# EAGLE board RK628H-2x22P-RevA (EAGLE 9.7.0)
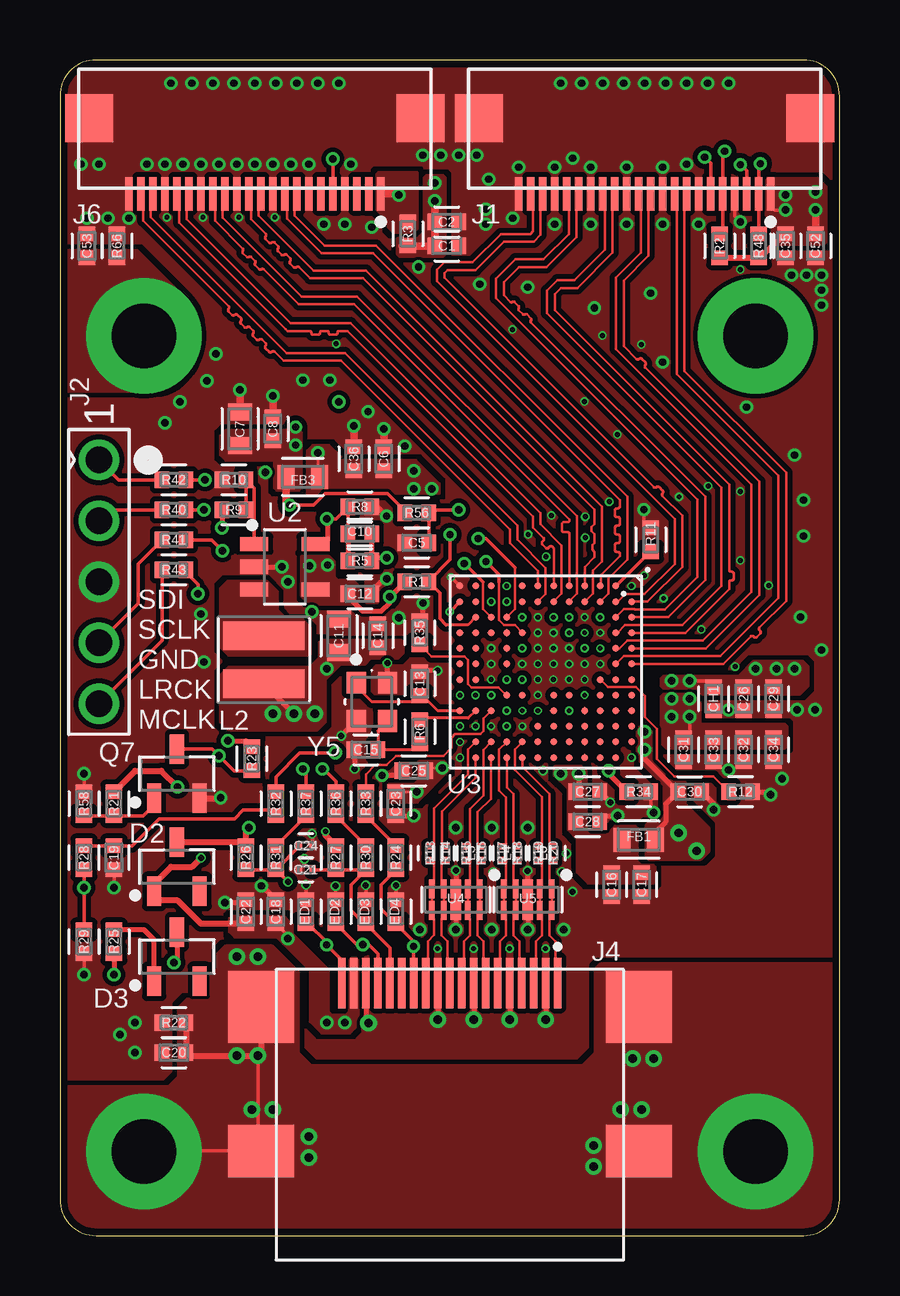
[diagram p6: board, top side]
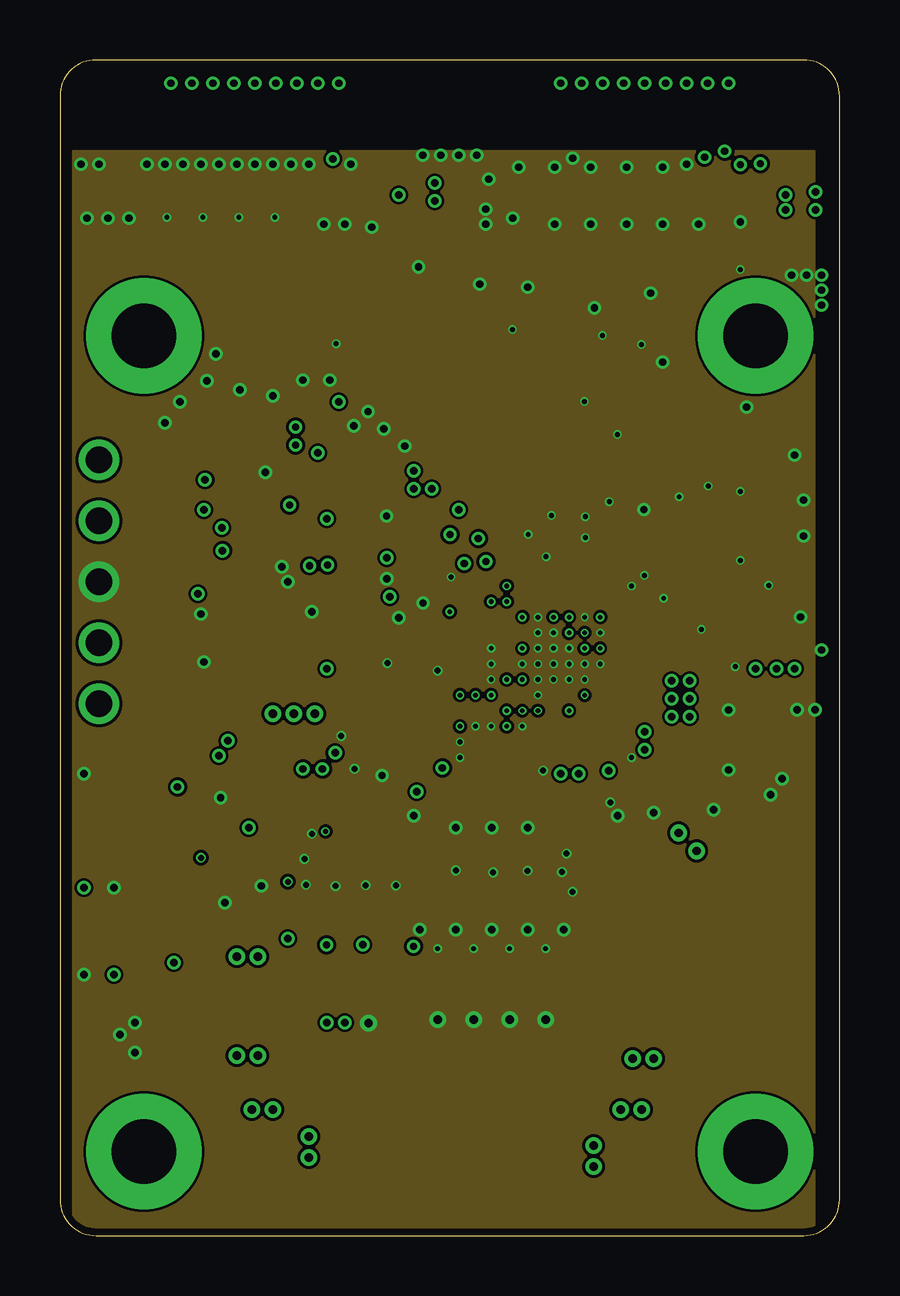
[diagram p7: board, inner layer Route2]
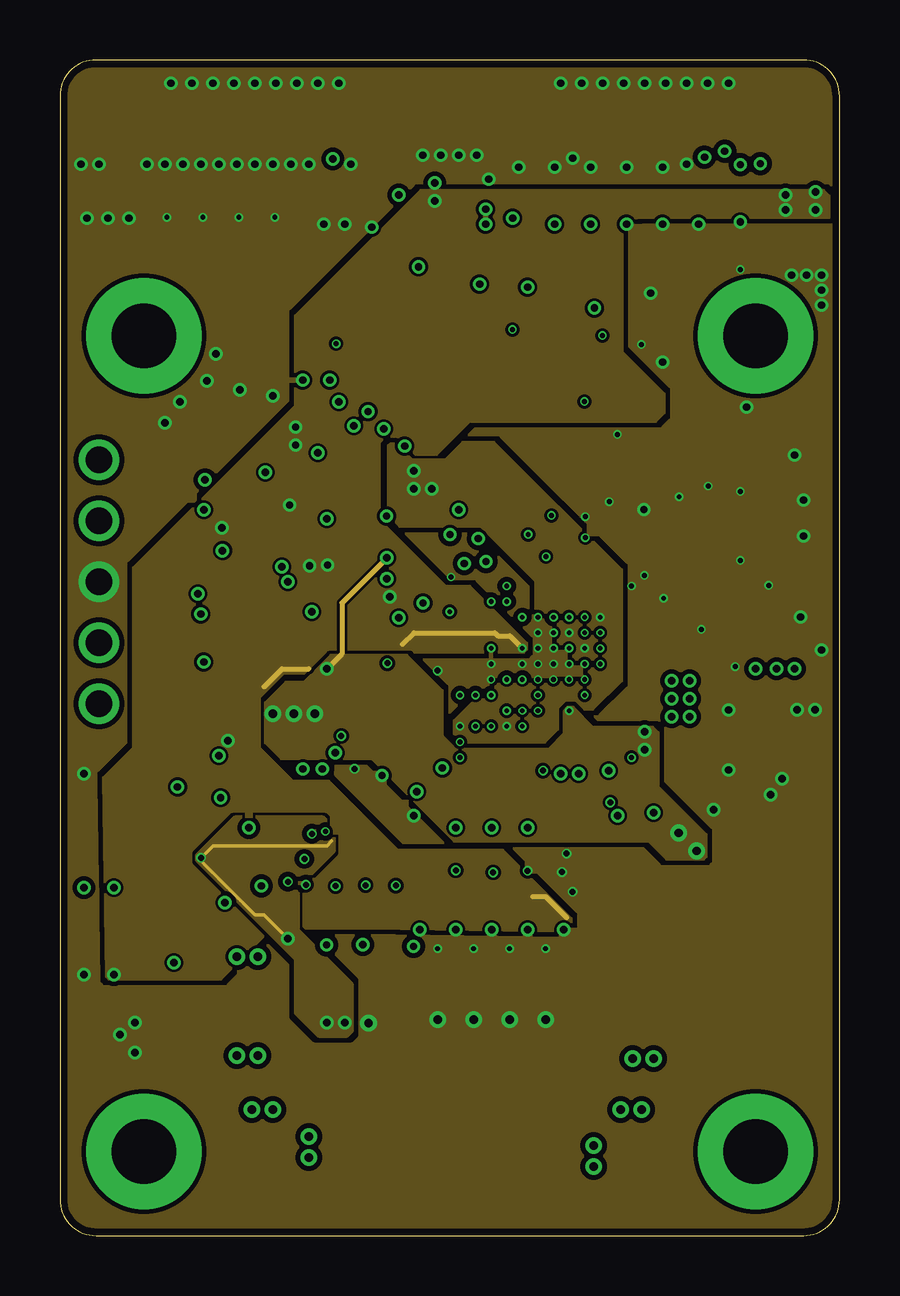
[diagram p8: board, inner layer Route15]
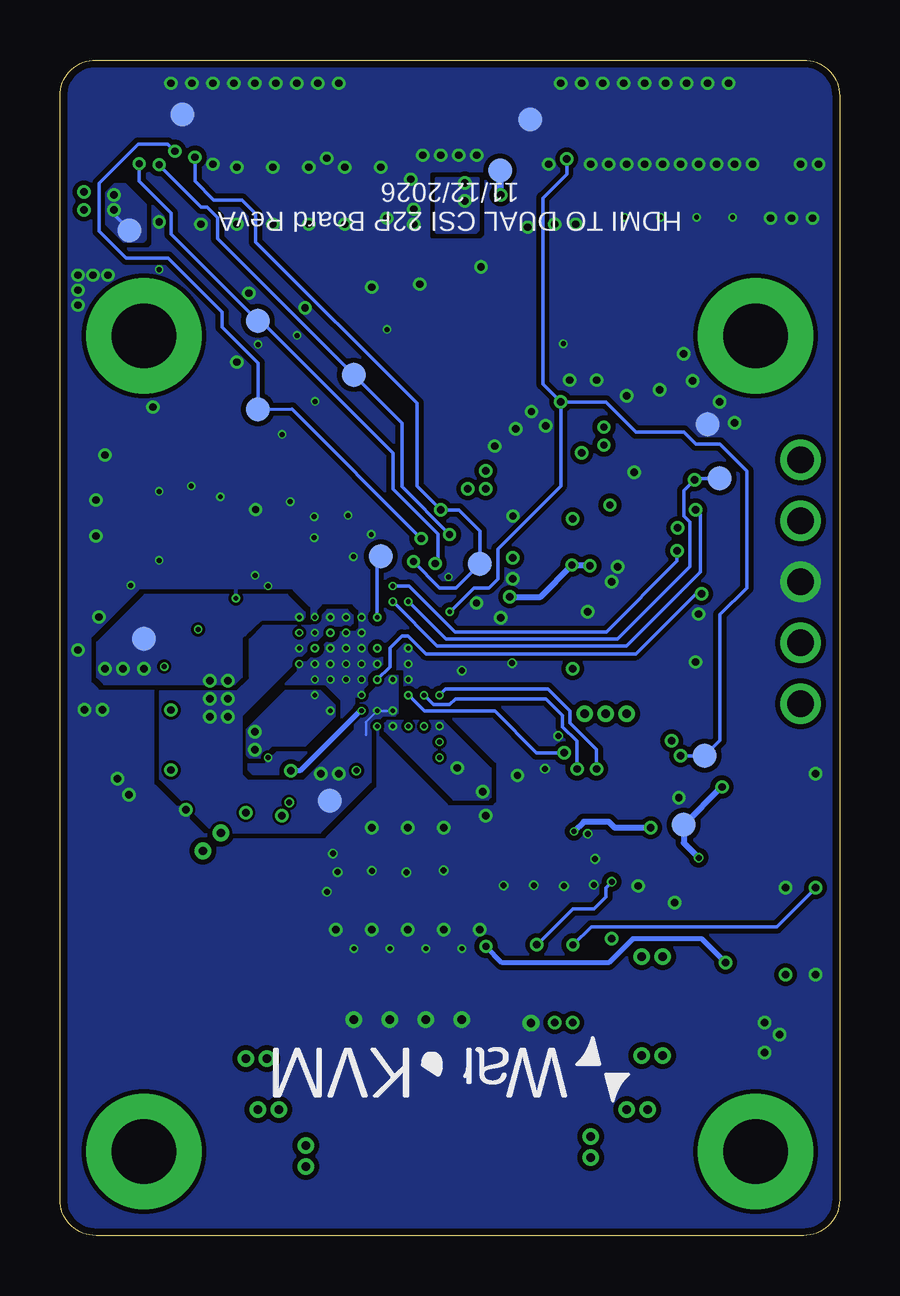
[diagram p9: board, bottom side, seen from below]

Size 32.5 x 49 mm. Coordinates in mm from the lower left corner, seen from the top.
Outline: 0,47.5 0,1.5 arc90 1.5,0 31,0 arc90 32.5,1.5 32.5,47.5 arc90 31,49 1.5,49 arc90 0,47.5
Copper layers (1+2*15+16): Top 0.035mm / dielectric 1.5mm / Route2 0.035mm / dielectric 0.15mm / Route15 0.035mm / dielectric 0.2mm / Bottom 0.035mm
Design rules "Fusion Electronics Design Rules *": minimum track width 0.1mm, minimum drill 0.2mm, track to track 0.12mm, track to pad 0.1mm, pad to pad 0.12mm, via to via 0.12mm, smd to smd 0.14mm, copper to edge 0.3mm, drill to drill 6mil, minimum pad ring 0mil, minimum via ring 0mil, stop-mask expansion 0mil, vias tented up to drill 9999mil, thermal gap 10mil
Net classes: 4 hdmi_diff: width 0.113 mm

## Footprints (pad centres in the part's own frame; a part is rotated, then mirrored left to right if it is on the bottom)
CAP_0402 = smd 0.6 x 0.7: 1 -0.5,0; 2 0.5,0
CAP_0603 = smd 0.7 x 1: 1 -0.7,0; 2 0.7,0
CAP_0201 = smd 0.25 x 0.35: 1 -0.275,0; 2 0.275,0
SOT-23-3 = smd 1.229 x 0.592: 1 1.022,-0.95; 2 1.022,0.95; 3 -1.022,0
TVS_0402 = smd 0.6 x 0.7: 1 -0.5,0; 2 0.5,0
IND_0603 = smd 0.7 x 1: 1 -0.7,0; 2 0.7,0
CONN_FFC_1X22_0.5MM_SM_RA_0.5K-GX-22PWB-R = smd 0.3 x 1.4: 1 -5.25,1.575; 2 -4.75,1.575; 3 -4.25,1.575; 4 -3.75,1.575; 5 -3.25,1.575; 6 -2.75,1.575; 7 -2.25,1.575; 8 -1.75,1.575; 9 -1.25,1.575; 10 -0.75,1.575; 11 -0.25,1.575; 12 0.25,1.575; 13 0.75,1.575; 14 1.25,1.575; 15 1.75,1.575; 16 2.25,1.575; 17 2.75,1.575; 18 3.25,1.575; 19 3.75,1.575; 20 4.25,1.575; 21 4.75,1.575; 22 5.25,1.575 | smd 2 x 2: 23 -6.9,-1.575; 24 6.9,-1.575
HDR_1X05_2.54MM_TH_ST = drill 1.1 pad 1.7: 1 -5.08,0; 2 -2.54,0; 3 0,0; 4 2.54,0; 5 5.08,0
CONN_HDMI_A_SMT_RA_HC-HDMI0019T-4 = smd 0.3 x 2.1: 1 4.5,6.4; 2 4,6.4; 3 3.5,6.4; 4 3,6.4; 5 2.5,6.4; 6 2,6.4; 7 1.5,6.4; 8 1,6.4; 9 0.5,6.4; 10 0,6.4; 11 -0.5,6.4; 12 -1,6.4; 13 -1.5,6.4; 14 -2,6.4; 15 -2.5,6.4; 16 -3,6.4; 17 -3.5,6.4; 18 -4,6.4; 19 -4.5,6.4 | smd 2.75 x 2.2: 20 -7.875,-0.6; 21 7.875,-0.6 | smd 2.75 x 3: 22 -7.875,5.4; 23 7.875,5.4
IND_3MM_SQ_1.2MM_HEIGHT = smd 1.2 x 3.4: 1 -1,0; 2 1,0
BCMF062P120T = smd 0.25 x 0.35: 1 -0.275,0.3; 2 -0.275,-0.3; 3 0.275,-0.3; 4 0.275,0.3
MOUNTHOLE_M2.5_4.8MM_PAD = drill 2.7 pad 4.8: P$1 0,0
RES_0402 = smd 0.6 x 0.7: 1 -0.5,0; 2 0.5,0
RES_0201 = smd 0.25 x 0.35: 1 -0.275,0; 2 0.275,0
TEST_POINT_1MM = smd 1 x 1: P$1 0,0
SOT95P285X110-5N = smd 1.172 x 0.592: 1 -1.275,0.95; 2 -1.275,0; 3 -1.275,-0.95; 4 1.275,-0.95; 5 1.275,0.95
WBBGA144_8X8MM = smd 0.3 x 0.3: A1 -3.575,3.575; A2 -2.925,3.575; A3 -2.275,3.575; A4 -1.625,3.575; A5 -0.975,3.575; A6 -0.325,3.575; A7 0.325,3.575; A8 0.975,3.575; A9 1.625,3.575; A10 2.275,3.575; A11 2.925,3.575; A12 3.575,3.575; B1 -3.575,2.925; B2 -2.925,2.925; B3 -2.275,2.925; B4 -1.625,2.925; B5 -0.975,2.925; B6 -0.325,2.925; B7 0.325,2.925; B8 0.975,2.925; B9 1.625,2.925; B10 2.275,2.925; B11 2.925,2.925; B12 3.575,2.925; C1 -3.575,2.275; C2 -2.925,2.275; C3 -2.275,2.275; C4 -1.625,2.275; C5 -0.975,2.275; C6 -0.325,2.275; C7 0.325,2.275; C8 0.975,2.275; C9 1.625,2.275; C10 2.275,2.275; C11 2.925,2.275; C12 3.575,2.275; D1 -3.575,1.625; D2 -2.925,1.625; D3 -2.275,1.625; D4 -1.625,1.625; D5 -0.975,1.625; D6 -0.325,1.625; D7 0.325,1.625; D8 0.975,1.625; D9 1.625,1.625; D10 2.275,1.625; D11 2.925,1.625; D12 3.575,1.625; E1 -3.575,0.975; E2 -2.925,0.975; E3 -2.275,0.975; E4 -1.625,0.975; E5 -0.975,0.975; E6 -0.325,0.975; E7 0.325,0.975; E8 0.975,0.975; E9 1.625,0.975; E10 2.275,0.975; E11 2.925,0.975; E12 3.575,0.975; F1 -3.575,0.325; F2 -2.925,0.325; F3 -2.275,0.325; F4 -1.625,0.325; F5 -0.975,0.325; F6 -0.325,0.325; F7 0.325,0.325; F8 0.975,0.325; F9 1.625,0.325; F10 2.275,0.325; F11 2.925,0.325; F12 3.575,0.325; G1 -3.575,-0.325; G2 -2.925,-0.325; G3 -2.275,-0.325; G4 -1.625,-0.325; G5 -0.975,-0.325; G6 -0.325,-0.325; G7 0.325,-0.325; G8 0.975,-0.325; G9 1.625,-0.325; G10 2.275,-0.325; G11 2.925,-0.325; G12 3.575,-0.325; H1 -3.575,-0.975; H2 -2.925,-0.975; H3 -2.275,-0.975; H4 -1.625,-0.975; H5 -0.975,-0.975; H6 -0.325,-0.975; H7 0.325,-0.975; H8 0.975,-0.975; H9 1.625,-0.975; H10 2.275,-0.975; H11 2.925,-0.975; H12 3.575,-0.975; J1 -3.575,-1.625; J2 -2.925,-1.625; J3 -2.275,-1.625; J4 -1.625,-1.625; J5 -0.975,-1.625; J6 -0.325,-1.625; J7 0.325,-1.625; J8 0.975,-1.625; J9 1.625,-1.625; J10 2.275,-1.625; J11 2.925,-1.625; J12 3.575,-1.625; K1 -3.575,-2.275; K2 -2.925,-2.275; K3 -2.275,-2.275; K4 -1.625,-2.275; K5 -0.975,-2.275; K6 -0.325,-2.275; K7 0.325,-2.275; K8 0.975,-2.275; K9 1.625,-2.275; K10 2.275,-2.275; K11 2.925,-2.275; K12 3.575,-2.275; L1 -3.575,-2.925; L2 -2.925,-2.925; L3 -2.275,-2.925; L4 -1.625,-2.925; L5 -0.975,-2.925; L6 -0.325,-2.925; L7 0.325,-2.925; L8 0.975,-2.925; L9 1.625,-2.925; L10 2.275,-2.925; L11 2.925,-2.925; L12 3.575,-2.925; M1 -3.575,-3.575; M2 -2.925,-3.575; M3 -2.275,-3.575; M4 -1.625,-3.575; M5 -0.975,-3.575; M6 -0.325,-3.575; M7 0.325,-3.575; M8 0.975,-3.575; M9 1.625,-3.575; M10 2.275,-3.575; M11 2.925,-3.575; M12 3.575,-3.575
DFN2510-10 = smd 0.224 x 0.793: 1 -1,-0.455; 2 -0.5,-0.455; 4 0.5,-0.455; 5 1,-0.455; 6 1,0.455; 7 0.5,0.455; 9 -0.5,0.455; 10 -1,0.455 | smd 0.424 x 0.793: 3 0,-0.455; 8 0,0.455
CRYSTAL_SMD2016-4P = smd 0.9 x 0.8: 1 -0.8,-0.65; 2 0.8,-0.65; 3 0.8,0.65; 4 -0.8,0.65

## Placement (x,y rotation side)
C1  0.1uF 16V  [CAP_0402]  16.12,41.25 0 top
C2  10uF 10V  [CAP_0402]  16.12,42.25 0 top
C5  0.1uF 16V  [CAP_0402]  14.88,28.88 0 top
C6  10uF 10V  [CAP_0402]  13.5,32.38 270 top
C7  22uF 10V  [CAP_0603]  7.5,33.62 270 top
C8  0.1uF 16V  [CAP_0402]  8.88,33.62 270 top
C10  100pF 50V  [CAP_0402]  12.5,29.25 0 top
C11  22uF 10V  [CAP_0603]  11.62,25 270 top
C12  10uF 10V  [CAP_0402]  12.5,26.75 180 top
C13  33pF 50V  [CAP_0402]  15,23 270 top
C14  0.1uF 16V  [CAP_0402]  13.25,25 270 top
C15  33pF 50V  [CAP_0402]  12.75,20.25 0 top
C16  0.1uF 16V  [CAP_0402]  23,14.62 90 top
C17  10uF 10V  [CAP_0402]  24.25,14.62 90 top
C18  0.1uF 16V  [CAP_0402]  9,13.5 270 top
C19  0.1uF 16V  [CAP_0402]  2.25,15.75 90 top
C20  0.1uF 16V  [CAP_0402]  4.75,7.62 0 top
C21  NC/10pF 50V  [CAP_0201]  10.25,15.25 0 top
C22  1uF 25V  [CAP_0402]  7.75,13.5 270 top
C23  10uF 10V  [CAP_0402]  14,18 90 top
C24  NC/10pF 50V  [CAP_0201]  10.25,16.25 180 top
C25  0.1uF 16V  [CAP_0402]  14.75,19.38 0 top
C26  10uF 10V  [CAP_0402]  28.5,22.38 90 top
C27  0.1uF 16V  [CAP_0402]  22,18.5 180 top
C28  10uF 10V  [CAP_0402]  22,17.25 180 top
C29  0.1uF 16V  [CAP_0402]  29.75,22.38 90 top
C30  0.1uF 16V  [CAP_0402]  26.25,18.5 0 top
C31  0.1uF 16V  [CAP_0402]  26,20.25 90 top
C32  0.1uF 16V  [CAP_0402]  28.5,20.25 90 top
C33  10uF 10V  [CAP_0402]  27.25,20.25 90 top
C34  0.1uF 16V  [CAP_0402]  29.75,20.25 90 top
C35  0.1uF 16V  [CAP_0402]  30.25,41.25 270 top
C36  0.1uF 16V  [CAP_0402]  12.25,32.38 270 top
C52  10uF 10V  [CAP_0402]  31.5,41.25 270 top
C53  0.1uF 16V  [CAP_0402]  1.12,41.25 270 top
CH1  0.1uF 16V  [CAP_0402]  27.25,22.38 90 top
D2  BAT54  [SOT-23-3]  4.88,15.38 270 top
D3  BAT54  [SOT-23-3]  4.88,11.62 270 top
ED1  KLXES15AAA1  [TVS_0402]  10.25,13.5 270 top
ED2  KLXES15AAA1  [TVS_0402]  11.5,13.5 270 top
ED3  KLXES15AAA1  [TVS_0402]  12.75,13.5 270 top
ED4  KLXES15AAA1  [TVS_0402]  14,13.5 270 top
FB1  120Ω 2A  [IND_0603]  24.12,16.5 180 top
FB3  120Ω 2A  [IND_0603]  10.12,31.62 0 top
J1  0.5K-GX-22PWB-R  [CONN_FFC_1X22_0.5MM_SM_RA_0.5K-GX-22PWB-R]  24.38,45 180 top
J2  NC/1x5 Pin Header  [HDR_1X05_2.54MM_TH_ST]  1.62,27.25 270 top
J4  HC-HDMI0019T-4  [CONN_HDMI_A_SMT_RA_HC-HDMI0019T-4]  16.25,4.12 0 top
J6  0.5K-GX-22PWB-R  [CONN_FFC_1X22_0.5MM_SM_RA_0.5K-GX-22PWB-R]  8.12,45 180 top
L2  2.2uH 2.84A  [IND_3MM_SQ_1.2MM_HEIGHT]  8.5,24 270 top
L3  NC/BCMF062P120T  [BCMF062P120T]  15.75,15.94 270 top
L4  NC/BCMF062P120T  [BCMF062P120T]  17.25,15.94 270 top
L5  NC/BCMF062P120T  [BCMF062P120T]  18.75,15.94 270 top
L6  NC/BCMF062P120T  [BCMF062P120T]  20.25,15.94 270 top
MNT1  MOUNTHOLE_M2.5_4.8MM_PAD  [MOUNTHOLE_M2.5_4.8MM_PAD]  3.5,37.5 0 top
MNT2  MOUNTHOLE_M2.5_4.8MM_PAD  [MOUNTHOLE_M2.5_4.8MM_PAD]  29,37.5 0 top
MNT3  MOUNTHOLE_M2.5_4.8MM_PAD  [MOUNTHOLE_M2.5_4.8MM_PAD]  29,3.5 0 top
MNT4  MOUNTHOLE_M2.5_4.8MM_PAD  [MOUNTHOLE_M2.5_4.8MM_PAD]  3.5,3.5 0 top
Q7  S8050  [SOT-23-3]  4.88,19.25 270 top
R1  NC/2.2kΩ 1%  [RES_0402]  14.88,27.25 180 top
R2  2.2kΩ 1%  [RES_0402]  27.5,41.25 270 top
R3  0Ω 1%  [RES_0402]  14.5,41.75 270 top
R5  110kΩ 1%  [RES_0402]  12.5,28.12 180 top
R6  22Ω 1%  [RES_0402]  15,21 270 top
R8  120kΩ 1%  [RES_0402]  12.5,30.38 0 top
R9  10kΩ 1%  [RES_0402]  7.25,30.25 180 top
R10  100kΩ 1%  [RES_0402]  7.25,31.5 180 top
R11  4.02kΩ 1%  [RES_0402]  24.62,29 270 top
R12  10kΩ 1%  [RES_0402]  28.38,18.5 180 top
R13  2.2Ω 5%  [RES_0201]  15.44,15.94 90 top
R14  2.2Ω 5%  [RES_0201]  16.06,15.94 90 top
R15  2.2Ω 5%  [RES_0201]  16.94,15.94 90 top
R16  2.2Ω 5%  [RES_0201]  17.56,15.94 90 top
R17  2.2Ω 5%  [RES_0201]  18.44,15.94 90 top
R18  2.2Ω 5%  [RES_0201]  19.06,15.94 90 top
R19  2.2Ω 5%  [RES_0201]  19.94,15.94 90 top
R20  2.2Ω 5%  [RES_0201]  20.56,15.94 90 top
R21  10kΩ 1%  [RES_0402]  2.25,18 90 top
R22  1MΩ 1%  [RES_0402]  4.75,8.88 180 top
R23  10kΩ 1%  [RES_0402]  8,19.88 90 top
R24  100Ω 1%  [RES_0402]  14,15.75 90 top
R25  27kΩ 1%  [RES_0402]  2.25,12.25 270 top
R26  2kΩ 1%  [RES_0402]  7.75,15.75 270 top
R27  2kΩ 1%  [RES_0402]  11.5,15.75 270 top
R28  1kΩ 1%  [RES_0402]  1,15.75 90 top
R29  100kΩ 1%  [RES_0402]  1,12.25 90 top
R30  100Ω 1%  [RES_0402]  12.75,15.75 90 top
R31  100Ω 1%  [RES_0402]  9,15.75 90 top
R32  22Ω 1%  [RES_0402]  9,18 270 top
R33  22Ω 1%  [RES_0402]  12.75,18 270 top
R34  2kΩ 1%  [RES_0402]  24.12,18.5 180 top
R35  100Ω 1%  [RES_0402]  15,25.12 90 top
R36  22Ω 1%  [RES_0402]  11.5,18 270 top
R37  22Ω 1%  [RES_0402]  10.25,18 270 top
R40  33Ω 1%  [RES_0402]  4.75,30.25 180 top
R41  33Ω 1%  [RES_0402]  4.75,29 180 top
R42  33Ω 1%  [RES_0402]  4.75,31.5 180 top
R43  33Ω 1%  [RES_0402]  4.75,27.75 180 top
R48  NC/2.2kΩ 1%  [RES_0402]  29.12,41.25 270 top
R56  10kΩ 1%  [RES_0402]  14.88,30.12 180 top
R58  10kΩ 1%  [RES_0402]  1,18 270 top
R66  1MΩ 1%  [RES_0402]  2.38,41.25 90 top
TP1  TESTPOINT_1MM  [TEST_POINT_1MM]  5.5,33.81 180 bottom
TP2  TESTPOINT_1MM  [TEST_POINT_1MM]  5,31.56 180 bottom
TP3  TESTPOINT_1MM  [TEST_POINT_1MM]  19.12,28.31 180 bottom
TP4  TEST_POINT_1MM_0.5MM  [TEST_POINT_1MM]  24.25,34.44 180 bottom
TP5  TESTPOINT_1MM  [TEST_POINT_1MM]  29,24.88 0 bottom
TP6  TESTPOINT_1MM  [TEST_POINT_1MM]  21.25,18.12 0 bottom
TP7  TESTPOINT_1MM  [TEST_POINT_1MM]  29.6,41.9 0 bottom
TP8  TESTPOINT_1MM  [TEST_POINT_1MM]  14.15,44.4 0 bottom
TP9  TESTPOINT_1MM  [TEST_POINT_1MM]  12.89,46.52 0 bottom
TP10  TESTPOINT_1MM  [TEST_POINT_1MM]  27.39,46.73 0 bottom
TP11  TESTPOINT_1MM  [TEST_POINT_1MM]  15,28 0 bottom
TP12  TEST_POINT_1MM_0.5MM  [TEST_POINT_1MM]  24.25,38.12 180 bottom
TP13  TEST_POINT_1MM_0.5MM  [TEST_POINT_1MM]  20.25,35.88 180 bottom
TP14  TEST_POINT_1MM_0.5MM  [TEST_POINT_1MM]  6.5,17.12 180 bottom
TP15  TEST_POINT_1MM_0.5MM  [TEST_POINT_1MM]  5.62,20 180 bottom
U2  SY8089A1AAC  [SOT95P285X110-5N]  9.38,27.88 0 top
U3  RK628H  [WBBGA144_8X8MM]  20.25,23.5 270 top
U4  BTRD10A03  [DFN2510-10]  16.5,14 180 top
U5  BTRD10A03  [DFN2510-10]  19.5,14 180 top
Y5  24MHz 20pF  [CRYSTAL_SMD2016-4P]  13,22.25 270 top

## Tracks (layer width: path | path; a pad name or v marks a point on that pad's centre or on a via)
CGND  (via drill 0.35 pad 0.7)
  Top 0.152: J4.20 8.38,4.25 | J4.20 4.78,3.52 MNT4.P$1 | J4.20 8.25,3.65 v8.25,7.5
  Top 0.254: R22.1 C20.2 5.38,7.5 v7.38,7.5 v8.25,7.5 8.38,7.62 J4.22
  other vias: 7.38,11.62 8.25,11.62 22.25,2.88 22.25,3.75 23.88,7.38 24.75,7.38 23.38,5.25 24.25,5.25 8,5.25 8.88,5.25 10.38,4.12 10.38,3.25
  pour Top (no thermals): 4.95,6.56 4.56,6.16 4.52,6.15 0.1,6.15 0.1,0.1 32.27,0.1 32.27,11.27 22.54,11.27 22.35,11.08 22.35,7.6 22.34,7.57 21.81,7.04 21.77,7.02 10.48,7.02 10.44,7.04 9.91,7.57 9.9,7.6 9.9,10.96 8.83,12.02 6.92,12.02 6.6,11.71 6.6,11.1 6.59,11.07 4.97,9.45 4.97,6.6
GND  (via drill 0.2 pad 0.33, 0.2 pad 0.34, 0.2 pad 0.35, 0.25 pad 0.4, 0.3 pad 0.55, 0.35 pad 0.7)
  Top 0.113: R35.2 15.13,25.76
  Top 0.152: v24.34,30.27 24.34,29.78 R11.1 | U3.M1 v16.3,27.45 | v14,14.58 ED4.1 | ED3.1 v12.75,14.59 v12.74,14.6 | v11.49,14.57 ED2.1 | ED1.1 v10.25,14.62 | C24.1 10.53,16.73 v10.5,16.75 | C21.1 10.19,15.46 v10.19,15.7 | v1,10.88 R29.1 | R58.1 v1,19.25 | C19.1 v2.25,14.5 | R34.1 24.62,17.75 v24.75,17.62 | J1.4 28.12,42.48 v28.36,42.25
  Top 0.203: J4.5 v18.75,9 | J4.2 v20.25,9 | J4.8 v17.25,9 | J4.11 v15.75,9 | v19.5,12.75 U5.8 U5.3 v19.49,15.21 | v16.5,12.75 U4.8 U4.3 v16.5,15.22 | C15.1 12.28,20.22 v12.28,19.45 | Y5.2 v11.73,20.83 v11.73,20.82 | Y5.4 v13.65,23.85 v13.65,23.86 | v15.74,23.55 15.04,23.55 C13.1 | v12.86,8.85 12.75,8.97 J4.17 | U2.2 v9.25,27.88 | v13.62,29.99 13.23,30.38 R8.2 | 15.13,25.76 v15.13,26.36 | C28.1 22.75,17.5 v23.25,17.5 | v22.95,18.05 C27.1 | v29.62,18.38 29.5,18.5 R12.1 | v27.25,17.75 27.25,18 C30.2 | C25.1 14.05,19.17 v13.42,19.17 | C23.1 v14.75,17.5 | C22.1 7.62,13.88 v6.88,13.88 | C18.1 8.42,14.58 v8.39,14.58 | C12.1 13,26.88 13.5,27.38 v13.62,27.38
  Top 0.254: CH1.1 27.12,21.75 | Q7.2 6.68,18.23 v6.7,18.25
  Top 0.305: C52.2 | C7.1 v7.5,35.25 | C8.1 v8.88,35 | C36.1 v12.25,33.75 | C6.1 v13.5,33.62
  other vias: 17.32,21.23 16.68,20.57 16.68,19.93 17.98,21.23 23.82,19.93 19.27,21.23 17.98,23.18 17.98,23.82 17.98,24.48 19.27,23.82 19.93,23.18 19.93,22.52 20.57,23.18 21.23,23.18 21.88,23.18 19.93,23.82 19.93,24.48 19.93,25.12 20.57,25.12 20.57,24.48 21.23,24.48 20.57,23.82 21.23,23.82 21.88,23.82 22.52,23.82 22.52,25.12 21.88,25.77 19.93,25.77 8.56,31.81 9.5,27.25 10.5,26 14.12,25.75 23.82,27.07 18.06,15.13 21.12,15.92 20.93,15.15 21.37,14.33 30.11,19.04 18,12.75 16.5,17 18,17 19.5,17 20.14,19.38 20.24,11.96 18.74,11.96 17.24,11.96 15.74,11.96 21,12.75 15,12.75 3.12,8.88 3.12,7.62 2.5,8.38 30.73,21.92 31.48,21.92 27.87,21.9 27.87,19.4 24.62,39.28 22.28,38.66 17.5,39.65 19.5,39.53 18.87,42.4 13,42.03 11,42.15 1.12,42.4 2,42.4 0.87,44.65 1.62,44.65 15.12,45.03 15.87,45.03 16.62,45.03 17.37,45.03 4.62,48.03 5.5,48.03 6.37,48.03 7.25,48.03 8.12,48.03 9,48.03 9.87,48.03 10.75,48.03 21.75,48.03 22.62,48.03 23.5,48.03 24.37,48.03 25.25,48.03 26.12,48.03 27,48.03 27.87,48.03 3.62,44.65 4.37,44.65 5.12,44.65 5.87,44.65 7.37,44.65 2.87,42.4 8.87,44.65 10.37,44.65 19.12,44.53 17.87,44.03 20.62,44.53 21.37,44.9 22.12,44.53 23.62,44.53 26.12,44.65 25.12,44.53 14.95,40.38 31.75,40.03 31.12,40.03 31.75,39.4 30.5,40.03 31.75,38.78 25.12,36.4 28.62,34.53 31,30.65 31,29.15 30.87,25.78 31.75,24.4 11.25,35.65 10.12,35.65 12.84,34.35 14.37,32.9 5.87,25.9 6,23.9 25.12,42.15 23.62,42.15 22.12,42.15 20.62,42.15 26.62,42.15 17.75,42.15 17.75,42.78 11.87,42.15 12.12,44.65 6.62,44.65 8.12,44.65 9.62,44.65 4.46,42.44 5.96,42.44 7.46,42.44 8.96,42.44 11.62,48.03 20.87,48.03 25.81,30.79 28.37,28.14 28.37,31.02 29.55,27.1 26.74,25.27 25.17,26.56 24.37,27.52 28.15,23.71 27.03,31.24 22.62,37.52 24.24,37.14 28.37,40.27 30.62,32.53 21.87,34.77 18.87,37.77 23.24,33.39 20.49,30.02 21.9,29.09 21.9,29.97 22.9,30.59 20.26,28.3 19.52,29.22 11.51,37.17 6.12,35.62 4.38,33.88 5,34.75 6.5,36.75
  pour Route2 (no thermals): 0.56,-0.19 31.44,-0.19 31.44,45.19 0.56,45.19
  pour Top (no thermals): 9.42,26.16 9.6,25.97 10.24,25.97 10.27,25.96 11.16,25.08 14.42,25.08 14.42,26.05 13.16,26.05 12.92,25.81 12.89,25.8 10.48,25.8 10.46,25.81 9.81,26.46 9.8,26.48 9.8,28.3 7.2,28.3 7.2,27.62 8.68,27.62 8.71,27.61 9.41,26.91 9.42,26.88
  pour Top (isolate 0.203, rank 6, no thermals): -0.19,-0.19 32.57,-0.19 32.57,49.19 -0.19,49.19
  pour Bottom (isolate 0.203, rank 6, no thermals): -0.1,-0.15 32.66,-0.15 32.66,49.24 -0.1,49.24
  pour Route15 (isolate 0.203, rank 6, no thermals): -1.69,-0.19 32.69,-0.19 32.69,49.44 -1.69,49.44
HDMI_1-CEC  (via drill 0.3 pad 0.55)
  Top 0.152: J4.13 v14.75,12.05 14.75,12.25 ED4.2 13.38,13.62 13.38,14.62 R24.1
  Top 0.203: D3.3 4.88,11.5 v4.75,11.38
  Bottom 0.203: v4.75,11.38 5.75,12.38 8.62,12.38 9.62,11.38 14.07,11.38 v14.75,12.05
HDMI_1-HPD  (via drill 0.3 pad 0.55)
  Top 0.152: J4.19 11.75,11.47 v11.11,12.11 11.11,12.23 10.34,13 ED1.2 | R29.2 R28.1 v1,14.5
  Bottom 0.152: v1,14.5 2.62,12.88 10.34,12.88 v11.11,12.11
HDMI_1-SCL
  Top 0.152: J4.15 13.75,12 ED3.2 12.67,13 12.12,13.55 12.12,14.62 12.69,15.19 | R30.1 12.69,15.19 | 12.69,15.19 12.62,15.25 R27.2 C21.2
HDMI_1-SDA  (via drill 0.25 pad 0.4, 0.3 pad 0.55)
  Top 0.152: J4.16 13.25,11.75 12.88,12.12 v12.62,12.12 12.38,12.12 ED2.2 | R31.1 9.97,16.23 C24.2 | R26.2 R31.1 | R31.1 v9.5,14.75
  Bottom 0.152: v9.5,14.75 9.75,14.5 9.75,14.12 10.25,13.62 11.12,13.62 v12.62,12.12
HDMIRX_CEC
  Top 0.143: R33.2 R24.2
HDMIRX_DETN  (via drill 0.2 pad 0.35, 0.3 pad 0.55)
  Top 0.152: U3.M2 v16.25,26 | Q7.3 6.35,20.27 v6.62,20 7.25,19.38 R23.1 | J6.5 v11.38,44.88
  Bottom 0.143: v16.25,26 15.25,27 14.62,27 14.25,27.38 14.25,28.62 11.62,31.25 v11.62,34.75 12.38,35.5 12.38,43.25 11.38,44.25 v11.38,44.88
  Bottom 0.152: v11.62,34.75 9.75,34.75 8.5,33.5 6.5,33.5 6,33 5,33 3.88,31.88 3.88,27 5,25.88 5,20.63 TP15.P$1 v6.62,20
HDMIRX_HPD
  Top 0.152: R28.2 C19.2 3,16.25 4.12,17.38 7.29,17.38 7.64,17.73 8.77,17.73 R32.2
HDMIRX_SCL
  Top 0.143: R30.2 R36.2
HDMIRX_SDA
  Top 0.143: R37.2 R31.2
HRX0_1_N
  Top 0.113: J4.9 16.82,10.85 16.84,10.69 16.84,12.27 17.09,12.52 17.09,13.21 17,13.29 U4.9 U4.2 17.09,14.54 17.09,15.52 L4.3
HRX0_1_P
  Top 0.113: J4.7 17.66,10.94 17.66,12.25 17.41,12.5 17.41,13.46 U4.10 U4.1 17.41,14.54 17.41,15.52 L4.4
HRX0_N
  Top 0.113: U3.K11 17.65,20.25 17.65,18.33 17.1,17.79 17.1,16.32 16.99,16.21 L4.2
HRX0_P
  Top 0.113: U3.K12 17.96,19.91 17.96,18.2 17.41,17.66 17.41,16.32 17.53,16.21 R16.2
HRX1_1_N
  Top 0.113: J4.6 18.34,10.94 18.34,12.27 18.59,12.52 18.59,13.45 U5.6 U5.5 18.59,14.54 18.59,15.52 L5.3
HRX1_1_P
  Top 0.113: J4.4 19.16,10.94 19.16,12.25 18.91,12.5 18.91,13.45 U5.7 U5.4 18.91,14.54 18.91,15.52 L5.4
HRX1_N
  Top 0.113: U3.J11 18.31,20.26 18.31,18.55 18.59,18.27 18.59,16.35 L5.2
HRX1_P
  Top 0.113: U3.J12 18.62,18.69 18.91,18.4 18.91,16.32 19.01,16.21 L5.1
HRX2_1_N
  Top 0.113: J4.3 19.85,10.94 19.85,12.27 20.09,12.52 20.09,13.45 U5.9 U5.2 20.09,14.54 20.09,15.51 R19.1
HRX2_1_P
  Top 0.113: J4.1 20.66,10.94 20.66,12.26 20.41,12.5 20.41,13.45 U5.10 U5.1 20.41,14.54 20.41,15.52 L6.4
HRX2_N
  Top 0.113: U3.H11 18.96,20.26 18.96,19.41 20.09,18.28 20.09,16.32 19.97,16.21 R19.2
HRX2_P
  Top 0.113: U3.H12 19.28,19.54 20.4,18.41 20.4,16.32 20.51,16.21 L6.1
HRXC_1_N
  Top 0.113: J4.12 15.32,10.85 15.34,10.68 15.34,12.27 15.59,12.53 15.59,13.21 15.5,13.29 U4.6 U4.5 15.59,14.54 15.59,15.52 L3.3
HRXC_1_P
  Top 0.113: J4.10 16.16,11.02 16.16,12.27 15.91,12.52 15.91,13.21 16,13.29 U4.7 U4.4 15.91,14.54 15.91,15.52 L3.4
HRXC_N
  Top 0.113: U3.L11 17.01,20.26 17.01,19.21 15.6,17.8 15.6,16.32 15.49,16.21 L3.2
HRXC_P
  Top 0.113: U3.L12 17.32,19.91 17.32,19.07 15.93,17.67 15.93,16.32 16.04,16.21 R14.2
I2C_SCL_3V3  (via drill 0.3 pad 0.55)
  Top 0.127: U3.L3 17.01,25.45 16.1,25.45
  Top 0.152: 16.1,25.45 15.84,25.71 15.84,26.79 R1.1 15.38,27.29 16.26,28.17 v16.26,29.22 | J1.3 28.62,44.38 v28.37,44.63
  Bottom 0.152: v16.26,29.22 18.25,31.22 18.25,33.88 TP13.P$1 25.94,41.56 25.94,42.44 26.38,42.88 26.62,42.88 v28.37,44.62 v28.37,44.63
I2C_SDA_3V3  (via drill 0.3 pad 0.55)
  Top 0.1: U3.K3 17.63,26.12 17.63,27.24
  Top 0.152: v29.19,44.68 29.12,44.61 J1.2 R48.1 | 17.63,27.24 v16.85,28.01
  Bottom 0.152: v16.85,28.01 16.75,28.12 16.75,29.25 18.62,31.12 18.62,32.62 24.12,38.12 TP12.P$1 27.88,41.75 27.88,42.62 29.19,43.94 v29.19,44.68
I2S_HDMI_LRCK
  Top 0.143: R41.2 3.25,28 3.25,26.34 J2.4
I2S_HDMI_MCLK
  Top 0.143: R43.2 4.25,24.8 J2.5
I2S_HDMI_SCLK
  Top 0.143: R40.2 2.08,30.25 J2.2
I2S_HDMI_SDI
  Top 0.143: R42.2 2.46,31.5 J2.1
MIPI-CSI0-CK_N
  Top 0.113: U3.E1 21.24,27.09 21.24,29.24 arc90 21.16,29.32 20.97,29.32 20.92,29.37 20.92,29.67 20.98,29.73 21.16,29.73 arc90 21.24,29.81 21.24,29.84 12.26,38.82 10.12,38.82 9.94,38.82 | J6.15 6.38,43.28 6.47,43.19 6.47,42.29 | 6.47,42.29 | 9.94,38.82 8.48,40.28 arc90 8.39,40.28 arc-90 8.31,40.28 8.14,40.44 arc-90 8.14,40.53 arc90 8.14,40.62 7.97,40.79 arc90 7.88,40.79 arc-90 7.79,40.79 7.62,40.96 arc-90 7.62,41.05 arc90 7.62,41.13 6.47,42.29 | 6.47,42.29 | 9.94,38.82
MIPI-CSI0-CK_P
  Top 0.113: U3.E2 21.55,26.75 21.55,29.98 12.39,39.15 10.06,39.15 6.78,42.43 6.78,42.91 6.88,43 J6.14
MIPI-CSI0-D0_N
  Top 0.113: U3.G1 19.93,27.7 18.75,28.87 18.75,29.43 11.73,36.46 9.31,36.46 8.94,36.83 arc90 8.83,36.83 arc-90 8.71,36.83 8.57,36.98 arc-90 8.57,37.09 arc90 8.57,37.2 8.43,37.35 arc90 8.31,37.35 arc-90 8.2,37.35 8.06,37.49 arc-90 8.06,37.6 arc90 8.06,37.72 7.91,37.86 arc90 7.8,37.86 arc-90 7.69,37.86 7.54,38.01 arc-90 7.54,38.12 arc90 7.54,38.23 7.4,38.37 arc90 7.29,38.37 arc-90 7.17,38.37 7.03,38.52 arc-90 7.03,38.63 arc90 7.03,38.74 3.47,42.31 | J6.21 3.38,43 3.47,42.91 3.47,42.38 3.47,42.31 | 3.47,42.31
MIPI-CSI0-D0_P
  Top 0.113: U3.G2 20.25,26.75 20.25,27.83 19.07,29 19.07,29.58 11.88,36.78 9.45,36.78 3.78,42.44 3.78,42.91 3.88,43 J6.20
MIPI-CSI0-D1_N
  Top 0.113: U3.F1 20.6,27.1 20.6,28.64 20.52,28.71 arc90 20.41,28.71 20.36,28.66 arc-90 20.25,28.66 20.11,28.81 arc-90 20.11,28.92 20.16,28.97 arc90 20.16,29.08 19.72,29.52 19.72,29.97 11.99,37.71 11.65,37.71 arc90 11.57,37.63 arc-90 11.49,37.55 11.29,37.55 arc-90 11.21,37.63 arc90 11.13,37.71 10.92,37.71 arc90 10.84,37.63 arc-90 10.76,37.55 10.56,37.55 arc-90 10.48,37.63 arc90 10.4,37.71 9.75,37.71 9.49,37.71 | J6.18 4.88,43.19 4.97,43.1 4.97,42.23 9.41,37.78 9.49,37.71 | 9.49,37.71
MIPI-CSI0-D1_P
  Top 0.113: U3.F2 20.91,26.76 20.91,28.77 20.04,29.65 20.04,30.11 12.12,38.03 9.62,38.03 5.28,42.36 5.28,42.91 5.38,43 J6.17
MIPI-CSI0-D2_N
  Top 0.113: U3.D1 21.88,27.88 22.28,28.28 22.28,28.5 22.19,28.59 22.19,28.79 22.28,28.88 22.28,29.25 22.15,29.37 22.15,29.53 22.28,29.65 22.28,30.26 12.63,39.9 10.44,39.9 9.97,40.37 arc90 9.86,40.37 arc-90 9.74,40.37 9.6,40.51 arc-90 9.6,40.62 arc90 9.6,40.73 9.46,40.88 arc90 9.35,40.88 arc-90 9.23,40.88 9.09,41.02 arc-90 9.09,41.13 arc90 9.09,41.25 8.94,41.39 arc90 8.83,41.39 arc-90 8.72,41.39 8.57,41.53 arc-90 8.57,41.65 arc90 8.57,41.76 7.97,42.37 7.97,42.91 7.88,43 J6.12
MIPI-CSI0-D2_P
  Top 0.113: U3.D2 22.21,26.76 22.21,27.71 22.59,28.09 22.59,30.39 12.77,40.22 10.57,40.22 8.28,42.5 8.28,42.91 8.38,43 J6.11
MIPI-CSI0-D3_N
  Top 0.113: U3.C1 22.54,27.09 22.54,27.52 23.34,28.32 23.34,28.42 arc90 23.26,28.5 23.22,28.5 arc-90 23.14,28.58 23.14,28.78 arc-90 23.22,28.86 23.26,28.86 arc90 23.34,28.94 23.34,29.14 arc90 23.26,29.22 23.22,29.22 arc-90 23.14,29.3 23.14,29.51 arc-90 23.22,29.59 23.26,29.59 arc90 23.34,29.67 23.34,29.87 arc90 23.26,29.95 23.22,29.95 arc-90 23.14,30.03 23.14,30.23 arc-90 23.22,30.31 23.26,30.31 arc90 23.34,30.39 23.34,30.66 13.05,40.95 10.91,40.95 9.47,42.39 9.47,42.91 9.38,43 J6.9
MIPI-CSI0-D3_P
  Top 0.113: U3.C2 22.86,26.76 22.86,27.39 23.65,28.18 23.65,30.79 13.18,41.27 11.04,41.27 9.78,42.52 9.78,42.91 9.88,43 J6.8
MIPI-CSI1-CK_N
  Top 0.113: J1.15 22.62,42.87 22.72,42.78 22.72,41.09 21.44,39.82 20.74,39.82 20.31,39.38 20.31,38.44 27.58,31.17 27.58,27.08 25.94,25.44 23.56,25.44 23.25,25.12 U3.B4
MIPI-CSI1-CK_P
  Top 0.113: U3.A4 26.07,25.12 27.9,26.95 27.9,27.23 arc-90 27.98,27.31 28.01,27.31 arc90 28.09,27.39 28.09,27.59 arc90 28.01,27.67 27.98,27.67 arc-90 27.9,27.75 27.9,31.3 20.62,38.57 20.62,39.25 20.88,39.5 21.57,39.5 23.03,40.96 23.03,42.78 23.12,42.87 J1.14
MIPI-CSI1-D0_N
  Top 0.113: U3.B2 23.27,26.43 23.58,26.74 24.36,26.74 25.62,28 25.62,29.88 15.71,39.79 15.71,40.26 16.02,40.57 17.19,40.57 18.38,41.75 19.61,41.75 19.72,41.86 19.72,42.78 19.62,42.87 J1.21
MIPI-CSI1-D0_P
  Top 0.113: U3.A2 24.5,26.42 25.94,27.87 25.94,30.01 25.12,30.82 arc-90 25.12,30.94 arc90 25.12,31.05 24.98,31.19 arc90 24.87,31.19 arc-90 24.75,31.19 16.03,39.92 16.03,40.12 16.15,40.25 17.32,40.25 18.5,41.43 19.75,41.43 20.03,41.71 20.03,42.78 20.12,42.87 J1.20
MIPI-CSI1-D1_N
  Top 0.113: U3.B3 23.51,26.11 23.95,26.11 23.96,26.1 25.22,26.1 26.58,27.45 26.58,30.67 18.18,39.07 18.18,39.88 18.99,40.69 20.16,40.69 21.22,41.75 21.22,42.78 21.12,42.87 J1.18
MIPI-CSI1-D1_P
  Top 0.113: U3.A3 23.83,25.78 25.36,25.78 26.9,27.32 26.9,30.8 19.64,38.06 arc-90 19.64,38.14 arc90 19.64,38.22 19.46,38.4 arc90 19.38,38.4 arc-90 19.3,38.4 19.12,38.58 arc-90 19.12,38.66 arc90 19.12,38.74 18.95,38.91 arc90 18.87,38.91 arc-90 18.79,38.91 18.5,39.2 18.5,39.75 19.12,40.38 20.29,40.38 21.53,41.62 21.53,42.78 21.62,42.87 J1.17
MIPI-CSI1-D2_N
  Top 0.113: U3.B5 23.33,24.48 23.65,24.8 23.9,24.8 23.9,24.79 26.79,24.79 28.83,26.83 28.83,31.3 23.18,36.94 23.18,39.93 24.22,40.97 24.22,42.78 24.12,42.87 J1.12
MIPI-CSI1-D2_P
  Top 0.113: U3.A5 26.93,24.48 29.15,26.7 29.15,31.43 24.4,36.17 arc-90 24.4,36.28 arc90 24.4,36.4 24.26,36.54 arc90 24.14,36.54 arc-90 24.03,36.54 23.5,37.07 23.5,39.8 24.53,40.84 24.53,42.78 24.62,42.87 J1.11
MIPI-CSI1-D3_N
  Top 0.113: U3.B6 23.5,24.15 27.53,24.15 29.95,26.58 29.95,31.67 25.72,35.91 25.72,42.78 25.62,42.87 J1.9
MIPI-CSI1-D3_P
  Top 0.113: U3.A6 27.65,23.82 28.8,24.97 arc-90 28.91,24.97 28.93,24.95 arc90 29.05,24.95 29.19,25.09 arc90 29.19,25.2 29.16,25.23 arc-90 29.16,25.34 30.27,26.45 30.27,31.8 26.03,36.04 26.03,42.78 26.12,42.87 J1.8
N$1  (via drill 0.2 pad 0.35, 0.3 pad 0.55)
  Top 0.254: D2.3 7.6,16.4 R26.1 7.75,16.88 v7.88,17 | R27.1 11.07,16.68 v11.07,16.84
  Bottom 0.254: v7.88,17 9.38,17 9.62,17.25 10.66,17.25 v11.07,16.84
N$2
  Top 0.127: R6.2 14.75,20.25 C15.2 13.25,21.05 Y5.3
N$4  (via drill 0.3 pad 0.55)
  Top 0.305: J6.1 14.07,43.42 v14.12,43.38
  Bottom 0.305: TP8.P$1 14.15,43.4 v14.12,43.38
  pour Top (no thermals): 13.69,42.29 13.7,42.27 13.7,42.03 13.91,41.83 14.74,41.83 14.88,41.97 14.88,44.3 13.28,44.3 13.2,44.22 13.2,42.78
N$11
  Top 0.203: D3.1 3.92,12.32 3.5,12.75 R25.1
N$15  (via drill 0.2 pad 0.35, 0.3 pad 0.55)
  Top 0.143: R40.1 v6,30.25
  Bottom 0.143: U3.J2 16.78,24.58 8.88,24.58 5.8,27.66 5.8,30.05 v6,30.25
  other vias: 18.62,26.43
N$16  (via drill 0.2 pad 0.35, 0.3 pad 0.55)
  Top 0.143: R41.1 6.32,29 v6.77,28.54
  Bottom 0.143: U3.J1 17.95,27.07 16.03,25.16 9.72,25.16 6.77,28.11 v6.77,28.54
  other vias: 18.62,27.07
N$18  (via drill 0.2 pad 0.35, 0.3 pad 0.55)
  Top 0.143: R42.1 v6.04,31.5
  Bottom 0.143: U3.K2 16.41,24.86 9.27,24.86 6.24,27.89 6.24,29.74 6.5,30 6.5,31.06 6,31.56 TP2.P$1 5.98,31.56 v6.04,31.5
  other vias: 17.98,26.43
N$22  (via drill 0.2 pad 0.35, 0.3 pad 0.55)
  Top 0.143: R43.1 5.25,27.64 5.75,27.14 v5.75,26.75
  Bottom 0.143: U3.H7 18.75,23.7 18.75,24.5 18.25,25 18,25 17.25,24.25 8.5,24.25 6,26.75 v5.75,26.75
  other vias: 19.27,23.18
N$23
  pour Top (no thermals): 9.48,25.67 9.46,25.69 9.06,26.08 9.05,26.11 9.05,26.84 8.63,27.26 6.99,27.26 6.7,26.97 6.7,24.53 7.03,24.2 10.42,24.2 10.42,25.34 10.09,25.67
N$24
  Top 0.152: U3.B1 24.6,28.5 R11.2
N$25  (via drill 0.2 pad 0.33, 0.3 pad 0.55)
  Top 0.203: R34.2 22.88,19.25 v22.88,19.38
  Bottom 0.203: U3.G9 20,21.88 22.5,19.38 v22.88,19.38
  other vias: 19.93,21.88
N$26
  pour Top (no thermals): -1.17,35.2 3.79,35.2 4.05,35.22 4.3,35.28 4.53,35.38 4.75,35.51 4.95,35.68 5.09,35.82 5.34,36.11 5.54,36.44 5.68,36.79 5.77,37.15 5.8,37.53 5.8,37.68 5.78,37.98 5.71,38.27 5.59,38.54 5.44,38.8 5.24,39.02 3.22,41.05 -1.17,41.05
N$44
  Top 0.152: R58.2 R21.1 3.46,17.5 3.92,17.96 Q7.1
N$94  (via drill 0.2 pad 0.35, 0.3 pad 0.55)
  Top 0.152: v11.48,20.12 10,20.12 9,19.12 R32.1
  Bottom 0.152: U3.K8 17.31,21.86 14.38,21.86 12.64,20.12 v11.48,20.12
  other vias: 17.98,22.52
N$95  (via drill 0.2 pad 0.35, 0.3 pad 0.55)
  Top 0.152: v10.13,19.45 10.25,19.33 R37.1
  Bottom 0.152: U3.M8 16.43,22.77 12.15,22.77 11.25,21.88 11.25,21.38 10.13,20.25 v10.13,19.45
  other vias: 16.68,22.52
N$96  (via drill 0.2 pad 0.35, 0.3 pad 0.55)
  Top 0.152: R36.1 11.5,18.92 10.98,19.45 v10.94,19.45
  Bottom 0.152: U3.L8 16.94,22.14 16.26,22.14 16.02,22.38 12.25,22.38 11.54,21.67 11.54,21.21 10.94,20.61 v10.94,19.45
  other vias: 17.32,22.52
N$97
  Top 0.1: 17.52,20.9 16.48,20.9
  Top 0.102: U3.K9 17.65,21.55 17.65,21.03 17.52,20.9 | 16.48,20.9 16.32,20.74 16.32,20.34 15.98,20 14,20 13.62,19.61 13.14,19.61 12.75,19.22 R33.1
N$99
  Top 0.1: 18.27,22.85 17.15,22.85
  Top 0.113: U3.J8 18.6,22.52 18.27,22.85 | 17.15,22.85 17,23 17,24 16.86,24.14 15.48,24.14 R35.1
N$108  (via drill 0.2 pad 0.35)
  Bottom 0.152: TP3.P$1 19.27,28.16 U3.H3
  other vias: 19.27,25.77
N$110
  Top 0.113: U3.C7 22.84,22.86 24,22.86 24.38,22.49 24.38,21.62 24.88,21.12 24.88,19.88 25.6,19.15 27.23,19.15 R12.2
N$120  (via drill 0.3 pad 0.55)
  Top 0.152: v11.12,29.88 11.5,29.88 R8.1 C10.1
  Top 0.203: v11.12,29.88 11.15,29.85 11.15,28.95 11.03,28.82 U2.5 | C10.1 R5.2
N$157
  Top 0.152: U2.1 8.1,31.15 R10.1 R9.1
RK628_INTN_3V3  (via drill 0.3 pad 0.55)
  Top 0.1: 18.96,27.85 18.96,26.11 U3.J3
  Top 0.152: 18.96,27.85 17.75,29.05 v17.44,29.05 | R2.1 27.62,41.88 J1.5 27.62,45.11 v27.71,45.2
  Bottom 0.152: v17.44,29.05 22.83,34.44 TP4.P$1 24.25,36.38 25.75,37.88 25.75,38.5 28,40.75 29.75,40.75 30.88,41.88 30.88,43.88 29.25,45.5 28.01,45.5 v27.71,45.2
RK628_RSTN_3V3  (via drill 0.3 pad 0.55)
  Top 0.1: U3.H4 18.96,25.44 18.51,25.44 18.3,25.65 18.3,27.25
  Top 0.152: C5.2 R56.1 15.5,30.25 v16.62,30.25 | J1.6 27.12,44.69 v26.87,44.95 | v17.77,28.09 18.18,27.68 18.3,27.56 18.3,27.25
  Bottom 0.152: TP11.P$1 15,29.38 15.88,30.25 v16.62,30.25 17.62,31.25 17.62,34.7 24.34,41.41 24.34,42.59 24.91,43.16 26.09,43.16 26.87,43.95 v26.87,44.95 | 15.26,27.86 15.12,28 TP11.P$1 | v17.77,28.09 16.68,27 16,27 TP11.P$1
RK628_XTALI
  Top 0.127: U3.M9 15.75,21.88 15.12,22.5 C13.2 14.92,22.5 14.67,22.25 13,22.25 12.35,22.9 Y5.1
RK628_XTALO
  Top 0.12: 17.01,21.56 15.06,21.56
  Top 0.127: U3.L9 17.01,21.56 | 15.06,21.56 R6.1
VCC1V1_RK628  (via drill 0.2 pad 0.33, 0.2 pad 0.35, 0.3 pad 0.55, 0.35 pad 0.7)
  Top 0.203: L2.2 v9.75,21.75 | v24.38,20.25 24.38,19.88 C30.1 25.25,18 25.25,17.25 24.82,16.82 FB1.1 | C10.2 R5.1 13.12,28.25 v13.62,28.25
  Route15 0.203: v11.12,23.62 11.75,24.25 11.75,26.38 v13.62,28.25
  other vias: 21.88,22.52 21.23,21.88 8.88,21.75 10.62,21.75 25.79,16.78 24.38,21 26.54,16.03
  pour Top (no thermals): 10.81,24.08 10.42,23.69 10.39,23.67 7.03,23.67 6.7,23.34 6.7,21.41 7.03,21.08 10.72,21.08 11.05,21.41 11.05,23.14 11.06,23.17 11.71,23.81 11.73,23.83 12.72,23.83 12.96,24.06 12.98,24.08 14.09,24.08 14.3,24.28 14.3,24.72 14.22,24.8 10.91,24.8 10.83,24.72 10.83,24.11
  pour Bottom (no thermals): 21.08,21.66 22.28,20.45 23.64,20.45 23.67,20.44 24.16,19.95 24.59,19.95 24.67,20.03 24.67,21.09 23.09,22.67 21.66,22.67 21.08,22.09
  pour Route15 (no thermals): 12.99,19.86 16.42,16.43 24.52,16.43 25.27,15.68 26.85,15.68 26.95,15.77 26.95,16.73 24.95,18.73 24.95,20.98 24.73,21.2 22.23,21.2 21.41,22.02 21.17,22.02 21.02,21.87 21.02,20.94 20.36,20.29 16.52,20.29 15.95,20.85 15.95,22.73 14.48,24.2 11.27,24.2 10.15,23.07 9.4,23.07 8.55,22.23 8.55,20.52 9.22,19.86
  pour Top (no thermals): 25.23,17.85 25.21,17.82 24.48,17.08 24.48,15.79 24.54,15.73 26.71,15.73 27.02,16.04 27.02,16.96 26.04,17.94 26.02,17.98 26.02,18.9 25.23,18.9 25.19,18.91 25.16,18.94 25.15,18.98 25.15,19.21 24.66,19.69 24.65,19.73 24.65,21.08 24.58,21.15 24.17,21.15 24.1,21.08 24.1,19.92 25.21,18.81 25.23,18.77
VCC5V_HDMI_RX  (via drill 0.25 pad 0.4, 0.3 pad 0.55)
  Top 0.152: C18.2 9.5,12.5 v9.5,12.38 9.5,12.25
  Top 0.254: C22.2 5.88,13 4.91,13.96 3.94,13.96 3.92,13.98 D2.1 4,14.43 4,14.75 4.62,15.38 5.5,15.38 v5.88,15.75 | R21.2 3.12,19.38 4.22,19.38 v4.9,18.7
  Route15 0.152: v9.5,12.38 8.5,13.38 8.12,13.38 5.88,15.62 v5.88,15.75 6.38,16.25 11.12,16.25 11.32,16.44
  Bottom 0.254: v5.88,15.75 6.5,16.38 TP14.P$1 4.93,18.7 v4.9,18.7
  other vias: 11.88,8.88 11.12,8.88
  pour Top (no thermals): 7.27,12.43 9.02,12.43 10.43,11.02 10.43,8.9 10.9,8.43 12.1,8.43 12.44,8.77 12.44,11.48 12.35,11.57 12.15,11.57 12.06,11.48 12.06,9.35 11.9,9.19 11.35,9.19 11.19,9.35 11.19,11.1 9.69,12.6 9.69,12.98 9.35,13.32 7.15,13.32 7.06,13.23 7.06,12.65
  pour Route15 (isolate 0.203, no thermals): 9.84,11.56 9.85,11.52 9.85,9.29 10.79,8.35 11.96,8.35 12.15,8.54 12.15,10.46 9.91,12.69 9.9,12.73 9.9,14.52 9.91,14.56 11.4,16.04 11.4,16.96 10.96,17.4 7.29,17.4 5.73,15.83 5.73,15.67
VCC_3V3  (via drill 0.2 pad 0.35, 0.3 pad 0.55)
  Top 0.152: R2.2 R48.2 | R48.2 29.25,40.75 | J1.1 29.62,42.92 29.8,42.75 v30.25,42.75 | R56.2 14.38,30.19 13.65,30.92 11.04,30.92 10.57,30.44 v9.57,30.44 | R48.2 29.21,40.75 | 30.21,41.75 C35.1
  Top 0.203: R25.2 v2.25,10.88 | R23.2 7.75,20.62 v7,20.62 | R9.2 v6.75,29.5 | R1.2 v13.75,26.62 13.75,26.38 13.39,26.01 12.63,26.01 12,26.64 C12.2
  Top 0.254: 30.21,41.75 29.54,41.08 29.21,40.75 R2.2
  Top 0.305: v9.57,30.44 9.43,30.58 FB3.1 | C2.1 15.5,42.25 | C2.1 C1.1 | C52.1 v31.5,42.75 | C2.1 15.62,41.31 15.56,41.25 14.25,41.25 | v15.62,43.12 C2.1
  Route15 0.203: 21.12,13.25 20.25,14.12 19.72,14.12 | 8.5,22.88 9.25,23.62 10.38,23.62 | 14.26,24.64 14.75,25.12 18.12,25.12 18.25,25 18.75,25 U3.H5
  Bottom 0.152: v30.25,42.75 30.25,42.55 TP7.P$1
  Bottom 0.254: v13.75,26.62 12.47,26.62 v11.15,27.94 10.43,27.94 v10.4,27.92
  other vias: 19.27,24.48 9.82,32.94 9.82,33.69 30.25,43.38 31.5,43.5 15.62,43.88
  pour Route15 (rank 2, no thermals): 3.06,27.85 3.06,20.35 1.81,19.1 1.93,10.77 2.02,10.68 6.73,10.68 8.85,12.81 12.73,12.81 12.73,12.81 12.75,12.81 12.77,12.81 12.77,12.81 21.32,12.68 21.32,13.23 18.48,16.07 14.1,16.07 11.23,18.94 9.73,18.94 8.32,20.35 8.32,22.4 9.35,23.43 10.23,23.43 11.23,24.43 14.65,24.43 14.77,24.31 19.35,24.31 19.47,24.42 19.47,24.7 17.1,27.07 16.1,27.07 13.32,29.85 13.32,33.02 13.6,33.31 14.02,33.31 14.77,32.56 15.73,32.56 17.1,33.93 24.85,33.93 25.19,34.27 25.19,35.1 23.44,36.85 23.44,41.77 24.1,42.43 32.07,42.43 32.07,43.35 31.85,43.57 15.02,43.57 9.81,38.35 9.81,34.6
  pour Top (no thermals): 6.68,32.52 6.9,32.31 8.9,32.31 8.93,32.27 8.93,31.15 9.02,31.06 9.98,31.06 10.07,31.15 10.07,33.48 9.98,33.57 6.9,33.57 6.68,33.35
  pour Top (rank 2, no thermals): 11.61,27.3 11.58,27.31 11.44,27.46 11.42,27.48 11.42,28.09 11.22,28.3 10.08,28.3 10.08,26.66 10.41,26.33 12.34,26.33 12.42,26.41 12.42,27.09 12.22,27.3
  pour Top (no thermals): 29.69,42.29 29.7,42.27 29.7,41.53 29.91,41.33 31.84,41.33 31.92,41.41 31.92,43.72 31.59,44.05 29.53,44.05 29.45,43.97 29.45,42.53
  pour Bottom (no thermals): 15.16,41.83 16.8,41.83 16.8,44.05 15.08,44.05 15.08,41.91
  pour Bottom (no thermals): 29.03,41.45 29.84,41.45 30.55,42.16 30.55,43.47 30.22,43.8 29.78,43.8 28.95,42.97 28.95,41.53
  pour Top (no thermals): 15.19,41.83 14.91,41.56 14.89,41.54 14.08,41.54 14.08,40.91 14.16,40.83 15.97,40.83 16.05,40.91 16.05,44.09 15.97,44.17 15.28,44.17 15.2,44.09 15.2,41.86
VCCA1V1_RK628  (via drill 0.2 pad 0.33, 0.2 pad 0.35, 0.3 pad 0.55)
  Top 0.143: v26.25,21.62 26.25,21 C31.2
  Top 0.203: v21.62,19.25 21.62,18.62 C27.2
  Bottom 0.113: 19.75,20.88 19.75,21.4 U3.H9 U3.J9
  other vias: 19.27,21.88 18.62,21.88 18.62,23.18 22.52,24.48 21.88,25.12 21.23,25.77 20.57,25.77 20.88,19.25 25.5,21.62 26.25,22.38 25.5,22.38
  pour Bottom (no thermals): 20.4,25.43 21.15,25.43 25.27,21.3 28.32,21.3 28.32,22.63 25.17,22.63 24.57,23.23 24.57,24.85 24.03,25.4 22.03,25.4 21.35,26.07 20.52,26.07 20.3,25.85 20.3,25.52
  pour Bottom (no thermals): 18.52,21.68 19.02,21.68 19.55,21.15 19.55,18.9 21.65,16.8 26.1,16.8 28.32,19.02 28.32,22.67 24.93,22.67 24.93,19.23 24.65,18.95 22.35,18.95 20.2,21.1 20.2,21.98 18.85,23.32 18.43,23.32 18.43,21.77
  pour Top (no thermals): 21.17,18.61 21.17,16.9 21.55,16.52 21.55,15.15 22.02,14.68 24.73,14.68 24.82,14.77 24.82,15.35 24.73,15.45 24.23,15.45 24.07,15.6 24.07,16.98 23.98,17.07 23.15,17.07 22.77,16.7 22.1,16.7 21.95,16.85 21.95,19.35 21.73,19.57 20.65,19.57 20.6,19.53 20.6,19.17
  pour Top (no thermals): 30.3,21.22 30.22,21.3 26.73,21.3 26.71,21.31 26.69,21.33 26.67,21.36 26.67,22.22 26.34,22.55 25.16,22.55 25.08,22.47 25.08,20.53 25.28,20.33 30.22,20.33 30.3,20.41
VCCA3V3_RK628  (via drill 0.2 pad 0.35, 0.3 pad 0.55)
  Top 0.102: v15.94,19.49 15.37,19.49 C25.2 | C23.2 v14.88,18.5
  Top 0.113: v10.75,32.62 10.75,31.7 FB3.2
  Top 0.143: CH1.2 27,23.12 v26.25,23.12
  other vias: 16.68,21.23 18.62,21.23 21.88,24.48 21.23,25.12 22.52,25.77 14.75,31.12 15.5,31.12 14.75,31.88 25.5,23.12 29,23.62 30.62,23.62 29.88,23.62
  pour Bottom (no thermals): 14.65,18.18 16.1,18.18 18.95,21.02 18.95,21.35 18.85,21.45 16.52,21.45 14.55,19.48 14.55,18.27
  pour Top (no thermals): 10.3,30.93 15.82,30.93 15.82,31.35 14.85,32.32 11.63,32.32 11.62,32.32 11.61,32.32 11.6,32.32 11.59,32.33 11.58,32.34 11.58,32.35 11.57,32.35 11.57,32.37 11.57,32.38 11.57,32.39 11.57,32.4 11.58,32.41 11.59,32.42 11.6,32.42 11.6,32.43 11.62,32.43 11.72,32.46 11.23,32.95 10.52,32.95 10.3,32.73
  pour Bottom (no thermals): 24.8,25.02 24.8,25.02 24.93,24.9 24.93,23.27 25.21,22.99 30.66,22.99 30.95,23.27 30.95,24.73 28.98,26.7 23.02,26.7 22.3,25.98 22.3,25.77 22.42,25.66 24.09,25.68 24.11,25.68 24.11,25.68 24.11,25.68 24.12,25.66 24.77,25.05 24.77,25.05 24.79,25.04
  pour Route15 (no thermals): 19.81,27.27 19.81,24.36 19.4,23.94 18.9,23.94 16.43,21.48 16.43,20.9 16.77,20.56 20.23,20.56 20.76,21.09 20.76,21.97 21.1,22.31 21.48,22.31 21.86,21.93 22.23,21.93 23.42,23.12 23.42,27.75 18.1,33.07 16.77,33.07 16.05,32.34 14.7,32.34 14.03,33.02 13.77,33.02 13.68,32.92 13.68,30.02 14.15,29.56 17.52,29.56
  pour Top (no thermals): 14.93,19.73 14.93,18.98 14.77,18.82 13.68,18.82 13.68,18.05 14.9,18.05 16.23,19.38 16.23,19.58 15.98,19.82 15.02,19.82
  pour Top (no thermals): 26.52,22.83 26.54,22.81 26.78,22.58 30.84,22.58 31.17,22.91 31.17,23.72 30.97,23.92 28.91,23.92 28.29,23.31 28.27,23.3 25.16,23.3 25.08,23.22 25.08,22.91 25.16,22.83

## Text on the board
tPlace: SDI | SCLK | GND | LRCK | MCLK
bPlace: HDMI TO DUAL CSI 22P Board RevA / 11/12/2026